# Altium schematic sheet Chip.SchDoc
size D; SheetNumber: 7; SheetTotal: 8
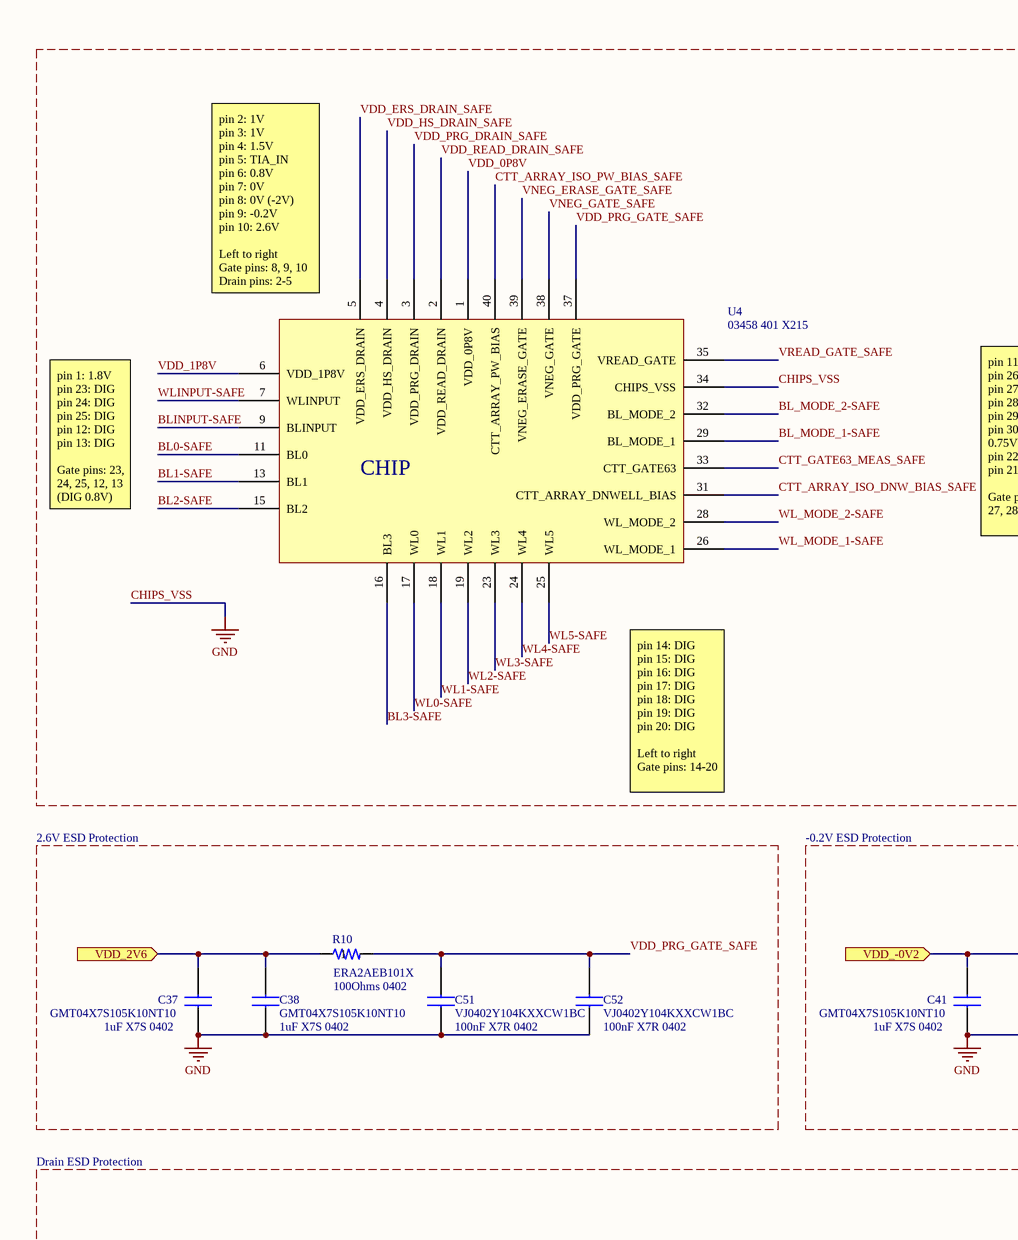
[diagram p0: Chip.SchDoc, top left]
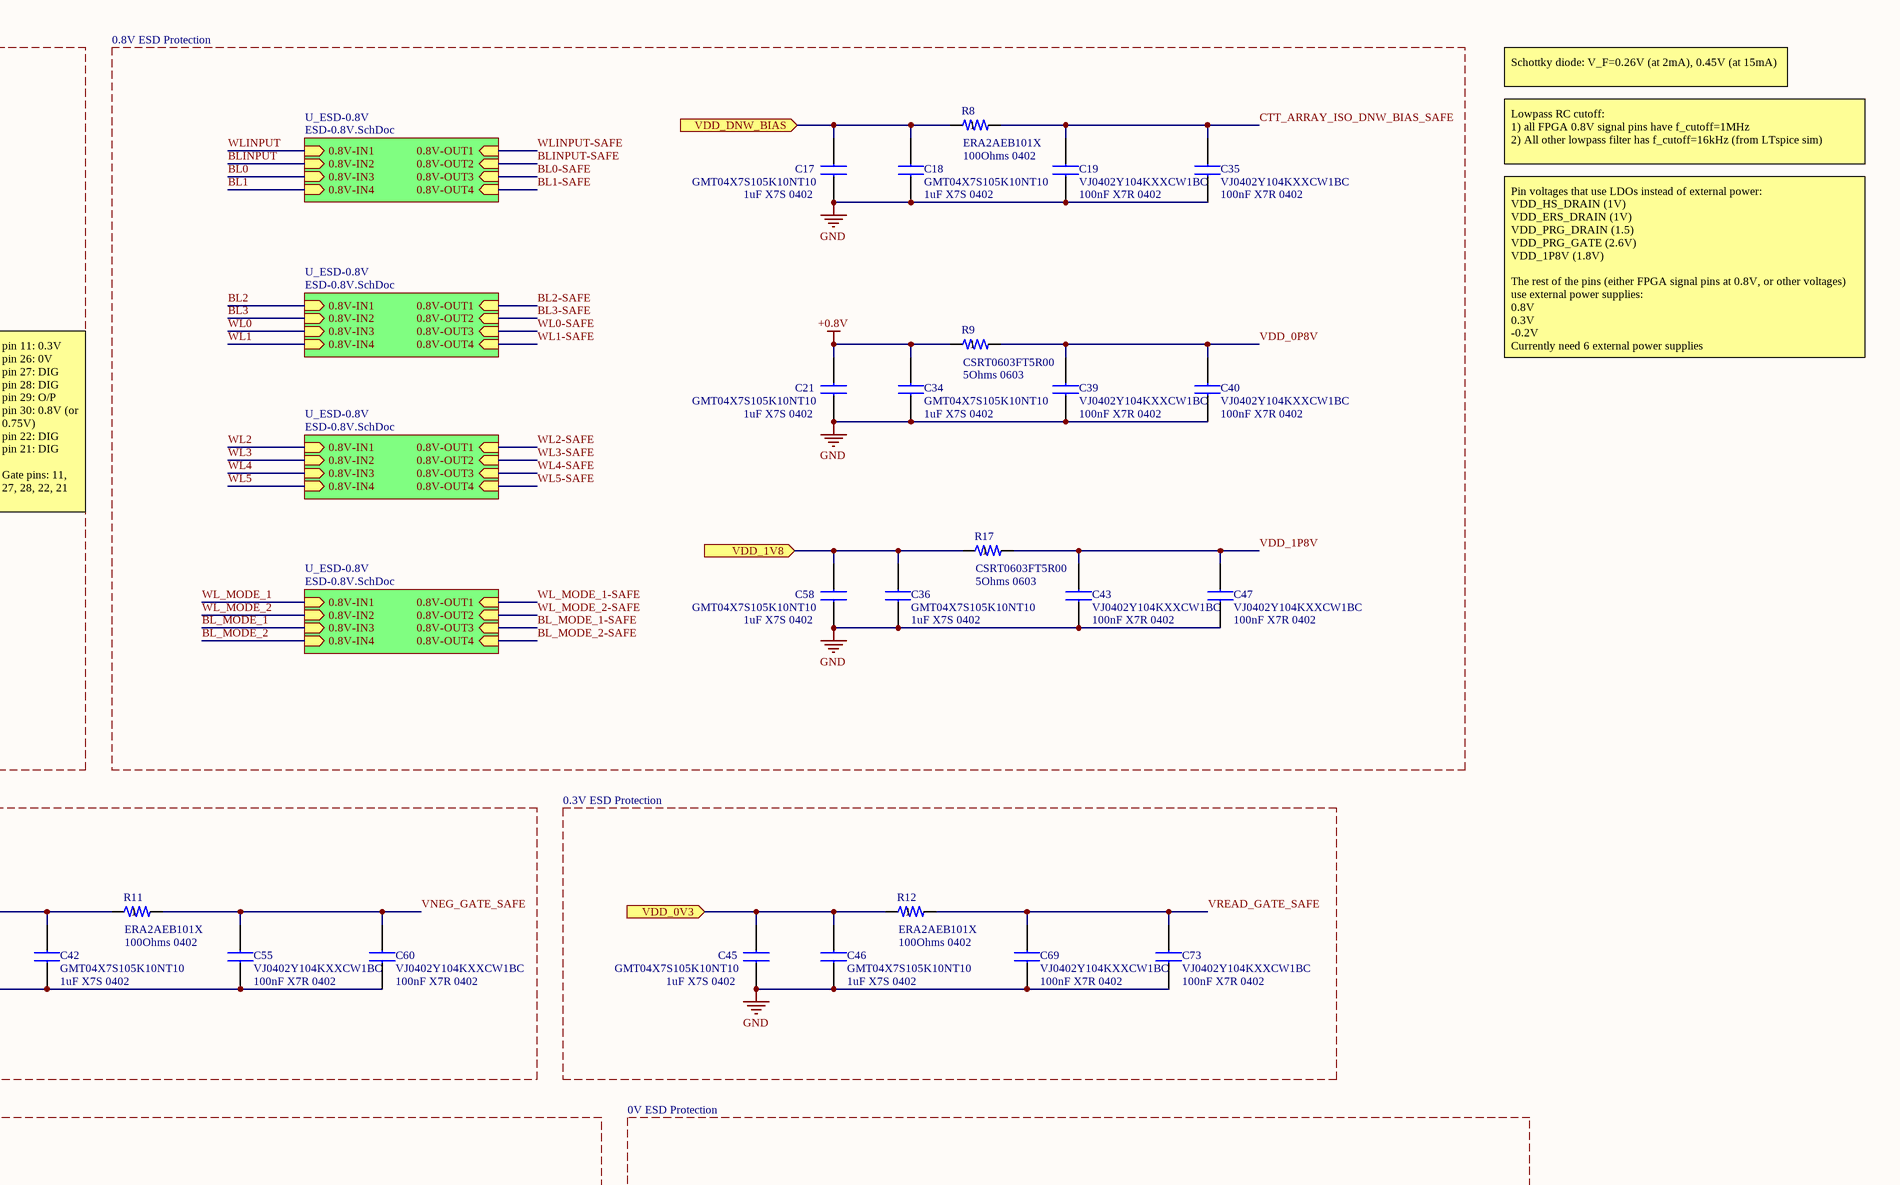
[diagram p1: Chip.SchDoc, top right]
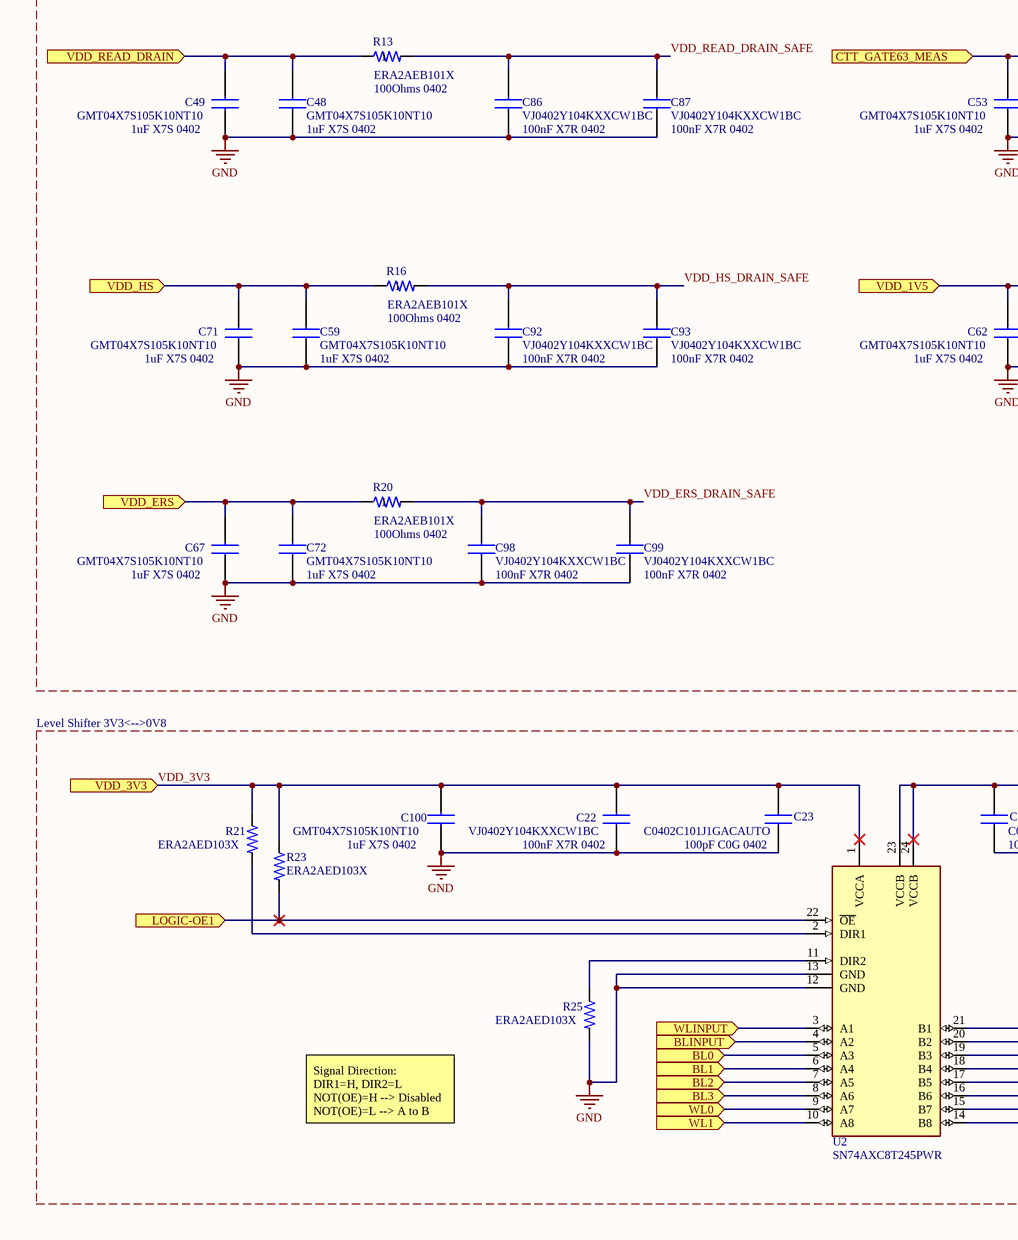
[diagram p2: Chip.SchDoc, bottom left]
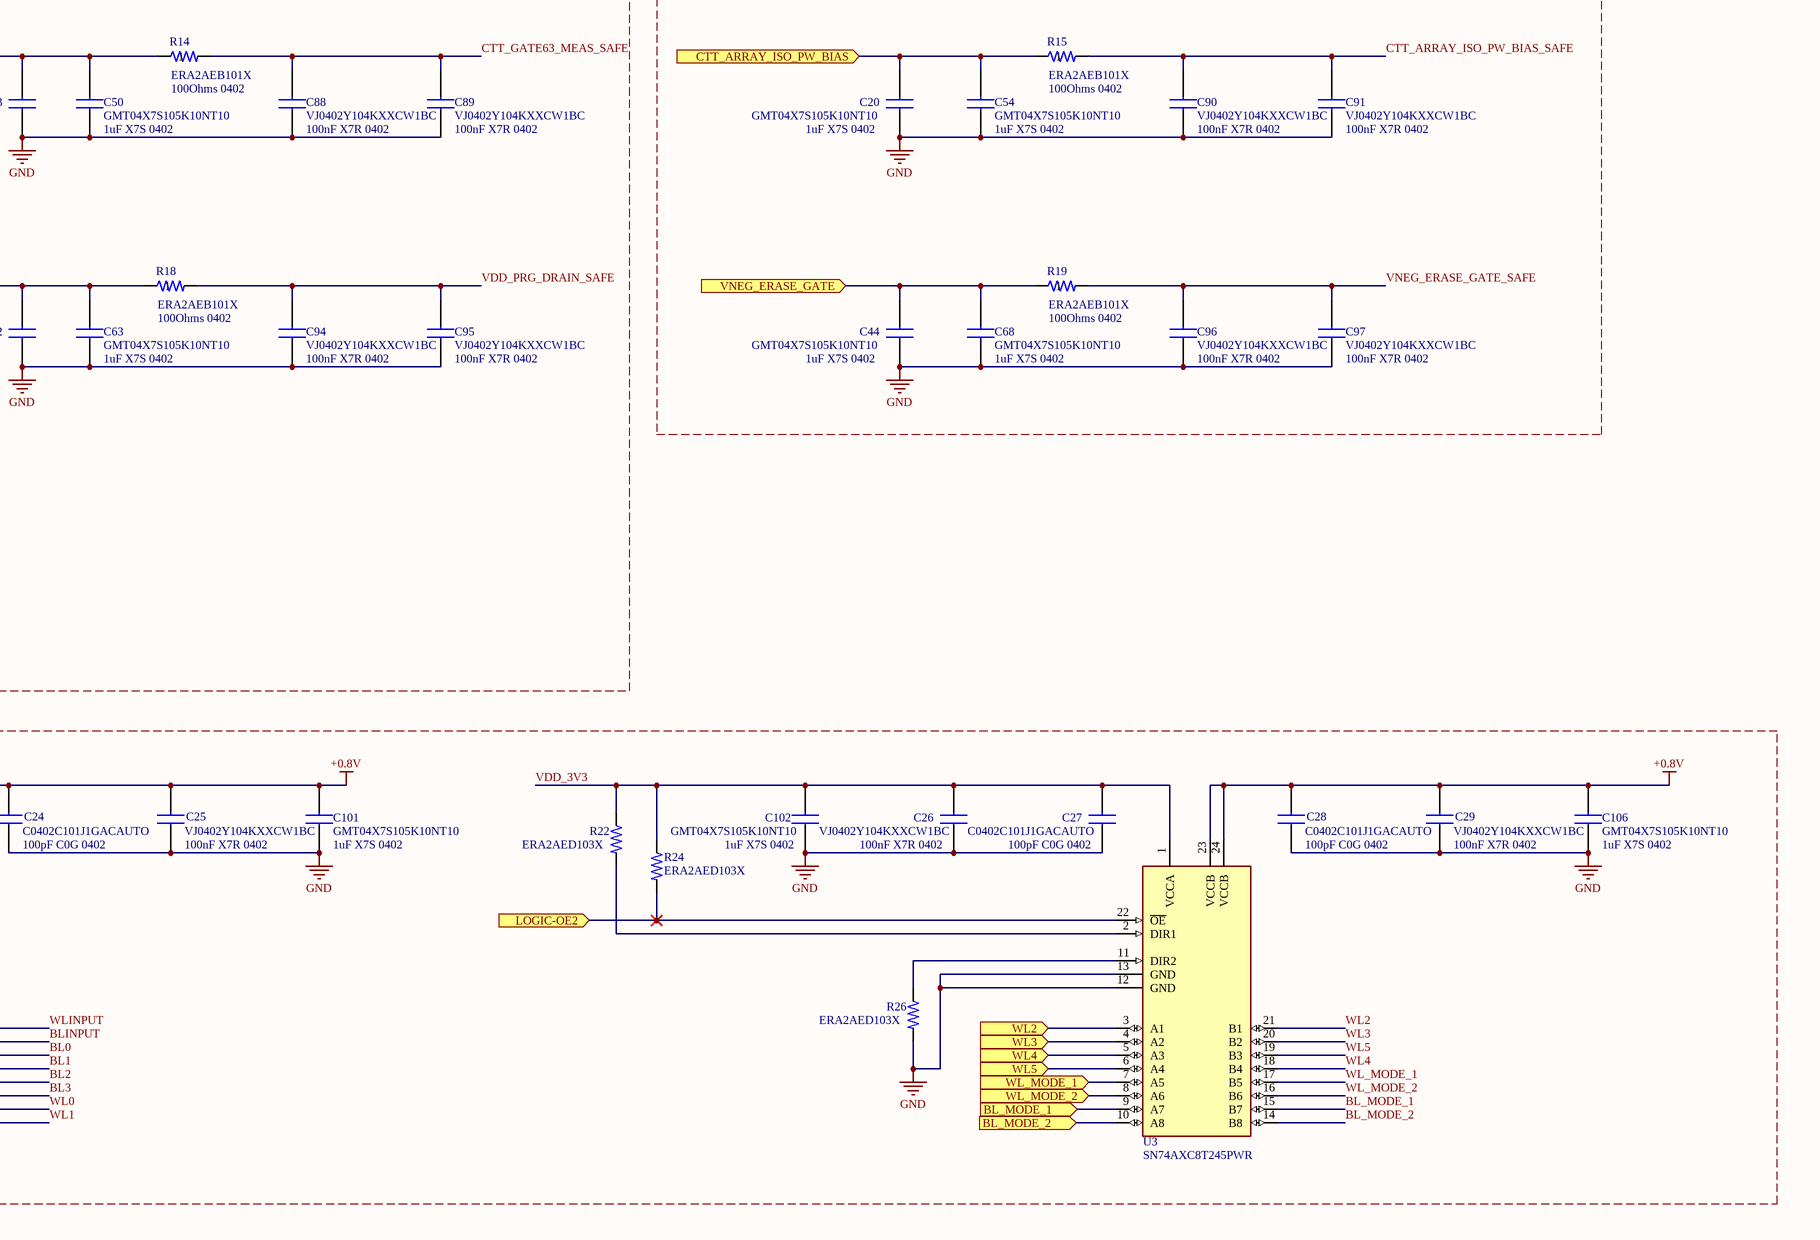
[diagram p3: Chip.SchDoc, bottom right]

## Parts
C17  GMT04X7S105K10NT10  [CAPC1005X55N]
C18  GMT04X7S105K10NT10  [CAPC1005X55N]
C19  VJ0402Y104KXXCW1BC  [CAPC1005X55N]
C20  GMT04X7S105K10NT10  [CAPC1005X55N]
C21  GMT04X7S105K10NT10  [CAPC1005X55N]
C22  VJ0402Y104KXXCW1BC  [CAPC1005X55N]
C23  C0402C101J1GACAUTO  [CAPC1005X55N]
C24  C0402C101J1GACAUTO  [CAPC1005X55N]
C25  VJ0402Y104KXXCW1BC  [CAPC1005X55N]
C26  VJ0402Y104KXXCW1BC  [CAPC1005X55N]
C27  C0402C101J1GACAUTO  [CAPC1005X55N]
C28  C0402C101J1GACAUTO  [CAPC1005X55N]
C29  VJ0402Y104KXXCW1BC  [CAPC1005X55N]
C34  GMT04X7S105K10NT10  [CAPC1005X55N]
C35  VJ0402Y104KXXCW1BC  [CAPC1005X55N]
C36  GMT04X7S105K10NT10  [CAPC1005X55N]
C37  GMT04X7S105K10NT10  [CAPC1005X55N]
C38  GMT04X7S105K10NT10  [CAPC1005X55N]
C39  VJ0402Y104KXXCW1BC  [CAPC1005X55N]
C40  VJ0402Y104KXXCW1BC  [CAPC1005X55N]
C41  GMT04X7S105K10NT10  [CAPC1005X55N]
C42  GMT04X7S105K10NT10  [CAPC1005X55N]
C43  VJ0402Y104KXXCW1BC  [CAPC1005X55N]
C44  GMT04X7S105K10NT10  [CAPC1005X55N]
C45  GMT04X7S105K10NT10  [CAPC1005X55N]
C46  GMT04X7S105K10NT10  [CAPC1005X55N]
C47  VJ0402Y104KXXCW1BC  [CAPC1005X55N]
C48  GMT04X7S105K10NT10  [CAPC1005X55N]
C49  GMT04X7S105K10NT10  [CAPC1005X55N]
C50  GMT04X7S105K10NT10  [CAPC1005X55N]
C51  VJ0402Y104KXXCW1BC  [CAPC1005X55N]
C52  VJ0402Y104KXXCW1BC  [CAPC1005X55N]
C53  GMT04X7S105K10NT10  [CAPC1005X55N]
C54  GMT04X7S105K10NT10  [CAPC1005X55N]
C55  VJ0402Y104KXXCW1BC  [CAPC1005X55N]
C58  GMT04X7S105K10NT10  [CAPC1005X55N]
C59  GMT04X7S105K10NT10  [CAPC1005X55N]
C60  VJ0402Y104KXXCW1BC  [CAPC1005X55N]
C62  GMT04X7S105K10NT10  [CAPC1005X55N]
C63  GMT04X7S105K10NT10  [CAPC1005X55N]
C67  GMT04X7S105K10NT10  [CAPC1005X55N]
C68  GMT04X7S105K10NT10  [CAPC1005X55N]
C69  VJ0402Y104KXXCW1BC  [CAPC1005X55N]
C71  GMT04X7S105K10NT10  [CAPC1005X55N]
C72  GMT04X7S105K10NT10  [CAPC1005X55N]
C73  VJ0402Y104KXXCW1BC  [CAPC1005X55N]
C86  VJ0402Y104KXXCW1BC  [CAPC1005X55N]
C87  VJ0402Y104KXXCW1BC  [CAPC1005X55N]
C88  VJ0402Y104KXXCW1BC  [CAPC1005X55N]
C89  VJ0402Y104KXXCW1BC  [CAPC1005X55N]
C90  VJ0402Y104KXXCW1BC  [CAPC1005X55N]
C91  VJ0402Y104KXXCW1BC  [CAPC1005X55N]
C92  VJ0402Y104KXXCW1BC  [CAPC1005X55N]
C93  VJ0402Y104KXXCW1BC  [CAPC1005X55N]
C94  VJ0402Y104KXXCW1BC  [CAPC1005X55N]
C95  VJ0402Y104KXXCW1BC  [CAPC1005X55N]
C96  VJ0402Y104KXXCW1BC  [CAPC1005X55N]
C97  VJ0402Y104KXXCW1BC  [CAPC1005X55N]
C98  VJ0402Y104KXXCW1BC  [CAPC1005X55N]
C99  VJ0402Y104KXXCW1BC  [CAPC1005X55N]
C100  GMT04X7S105K10NT10  [CAPC1005X55N]
C101  GMT04X7S105K10NT10  [CAPC1005X55N]
C102  GMT04X7S105K10NT10  [CAPC1005X55N]
C106  GMT04X7S105K10NT10  [CAPC1005X55N]
R8  ERA2AEB101X  [RES_ERA2AEB101X]
R9  CSRT0603FT5R00  [RES_CSRT0603_STP]
R10  ERA2AEB101X  [RES_ERA2AEB101X]
R11  ERA2AEB101X  [RES_ERA2AEB101X]
R12  ERA2AEB101X  [RES_ERA2AEB101X]
R13  ERA2AEB101X  [RES_ERA2AEB101X]
R14  ERA2AEB101X  [RES_ERA2AEB101X]
R15  ERA2AEB101X  [RES_ERA2AEB101X]
R16  ERA2AEB101X  [RES_ERA2AEB101X]
R17  CSRT0603FT5R00  [RES_CSRT0603_STP]
R18  ERA2AEB101X  [RES_ERA2AEB101X]
R19  ERA2AEB101X  [RES_ERA2AEB101X]
R20  ERA2AEB101X  [RES_ERA2AEB101X]
R21  ERA2AED103X  [RES_ERA2A_PAN]
R22  ERA2AED103X  [RES_ERA2A_PAN]
R23  ERA2AED103X  [RES_ERA2A_PAN]
R24  ERA2AED103X  [RES_ERA2A_PAN]
R25  ERA2AED103X  [RES_ERA2A_PAN]
R26  ERA2AED103X  [RES_ERA2A_PAN]
U2  SN74AXC8T245PWR  [SOP65P640X120-24N]
U3  SN74AXC8T245PWR  [SOP65P640X120-24N]
U4  03458 401 X215  [03458 401 X215]

## Sub-sheets
U_ESD-0.8V = ESD-0.8V.SchDoc: 0.8V-IN1 (in), 0.8V-IN2 (in), 0.8V-IN3 (in), 0.8V-IN4 (in), 0.8V-OUT1 (in), 0.8V-OUT2 (in), 0.8V-OUT3 (in), 0.8V-OUT4 (in)
U_ESD-0.8V = ESD-0.8V.SchDoc: 0.8V-IN1 (in), 0.8V-IN2 (in), 0.8V-IN3 (in), 0.8V-IN4 (in), 0.8V-OUT1 (in), 0.8V-OUT2 (in), 0.8V-OUT3 (in), 0.8V-OUT4 (in)
U_ESD-0.8V = ESD-0.8V.SchDoc: 0.8V-IN1 (in), 0.8V-IN2 (in), 0.8V-IN3 (in), 0.8V-IN4 (in), 0.8V-OUT1 (in), 0.8V-OUT2 (in), 0.8V-OUT3 (in), 0.8V-OUT4 (in)
U_ESD-0.8V = ESD-0.8V.SchDoc: 0.8V-IN1 (in), 0.8V-IN2 (in), 0.8V-IN3 (in), 0.8V-IN4 (in), 0.8V-OUT1 (in), 0.8V-OUT2 (in), 0.8V-OUT3 (in), 0.8V-OUT4 (in)

## Ports
BL0 (in), BL1 (in), BL2 (in), BL3 (in), BL_MODE_1 (in), BL_MODE_2 (in), BLINPUT (in), CTT_ARRAY_ISO_PW_BIAS (in), CTT_GATE63_MEAS (in), LOGIC-OE1 (in), LOGIC-OE2 (in), VDD_0V3 (in), VDD_1V5 (in), VDD_1V8 (in), VDD_2V6 (in), VDD_3V3 (in), VDD_-0V2 (in), VDD_DNW_BIAS (in), VDD_ERS (in), VDD_HS (in), VDD_READ_DRAIN (in), VNEG_ERASE_GATE (in), WL0 (in), WL1 (in), WL2 (in), WL3 (in), WL4 (in), WL5 (in), WL_MODE_1 (in), WL_MODE_2 (in), WLINPUT (in)

## Nets
+0.8V: C21.2 C24.2 C25.2 C28.2 C29.2 C34.2 C101.2 C106.2 R9.1 U2.23(VCCB) U2.24(VCCB) U3.23(VCCB) U3.24(VCCB)
CHIPS_VSS: C17.1 C18.1 C19.1 C20.1 C21.1 C22.1 C23.1 C24.1 C25.1 C26.1 C27.1 C28.1 C29.1 C34.1 C35.1 C36.1 C37.1 C38.1 C39.1 C40.1 C41.1 C42.1 C43.1 C44.1 C45.1 C46.1 C47.1 C48.1 C49.1 C50.1 C51.1 C52.1 C53.1 C54.1 C55.1 C58.1 C59.1 C60.1 C62.1 C63.1 C67.1 C68.1 C69.1 C71.1 C72.1 C73.1 C86.1 C87.1 C88.1 C89.1 C90.1 C91.1 C92.1 C93.1 C94.1 C95.1 C96.1 C97.1 C98.1 C99.1 C100.1 C101.1 C102.1 C106.1 R25.2 R26.2 U2.12(GND) U2.13(GND) U3.12(GND) U3.13(GND) U4.34(CHIPS_VSS)  [also labelled GND]
BL0: U2.5(A3) ; port BL0
BL0: U2.19(B3) ; sheet U_ESD-0.8V/0.8V-IN3  [a separate net that carries the same name]
BL0-SAFE: U4.11(BL0) ; sheet U_ESD-0.8V/0.8V-OUT3
BL1: U2.6(A4) ; port BL1
BL1: U2.18(B4) ; sheet U_ESD-0.8V/0.8V-IN4  [a separate net that carries the same name]
BL1-SAFE: U4.13(BL1) ; sheet U_ESD-0.8V/0.8V-OUT4
BL2: U2.7(A5) ; port BL2
BL2: U2.17(B5) ; sheet U_ESD-0.8V/0.8V-IN1  [a separate net that carries the same name]
BL2-SAFE: U4.15(BL2) ; sheet U_ESD-0.8V/0.8V-OUT1
BL3: U2.8(A6) ; port BL3
BL3: U2.16(B6) ; sheet U_ESD-0.8V/0.8V-IN2  [a separate net that carries the same name]
BL3-SAFE: U4.16(BL3) ; sheet U_ESD-0.8V/0.8V-OUT2
BL_MODE_1: U3.9(A7) ; port BL_MODE_1
BL_MODE_1: U3.15(B7) ; sheet U_ESD-0.8V/0.8V-IN3  [a separate net that carries the same name]
BL_MODE_1-SAFE: U4.29(BL_MODE_1) ; sheet U_ESD-0.8V/0.8V-OUT3
BL_MODE_2: U3.10(A8) ; port BL_MODE_2
BL_MODE_2: U3.14(B8) ; sheet U_ESD-0.8V/0.8V-IN4  [a separate net that carries the same name]
BL_MODE_2-SAFE: U4.32(BL_MODE_2) ; sheet U_ESD-0.8V/0.8V-OUT4
BLINPUT: U2.4(A2) ; port BLINPUT
BLINPUT: U2.20(B2) ; sheet U_ESD-0.8V/0.8V-IN2  [a separate net that carries the same name]
BLINPUT-SAFE: U4.9(BLINPUT) ; sheet U_ESD-0.8V/0.8V-OUT2
CTT_ARRAY_ISO_DNW_BIAS_SAFE: C19.2 C35.2 R8.2 U4.31(CTT_ARRAY_DNWELL_BIAS)
CTT_ARRAY_ISO_PW_BIAS: C20.2 C54.2 R15.1 ; port CTT_ARRAY_ISO_PW_BIAS
CTT_ARRAY_ISO_PW_BIAS_SAFE: C90.2 C91.2 R15.2 U4.40(CTT_ARRAY_PW_BIAS)
CTT_GATE63_MEAS: C50.2 C53.2 R14.1 ; port CTT_GATE63_MEAS
CTT_GATE63_MEAS_SAFE: C88.2 C89.2 R14.2 U4.33(CTT_GATE63)
LOGIC-OE1: R23.2 U2.22(~{OE}) ; port LOGIC-OE1
LOGIC-OE2: R24.2 U3.22(~{OE}) ; port LOGIC-OE2
VDD_0P8V: C39.2 C40.2 R9.2 U4.1(VDD_0P8V)
VDD_0V3: C45.2 C46.2 R12.1 ; port VDD_0V3
VDD_1P8V: C43.2 C47.2 R17.2 U4.6(VDD_1P8V)
VDD_1V5: C62.2 C63.2 R18.1 ; port VDD_1V5
VDD_1V8: C36.2 C58.2 R17.1 ; port VDD_1V8
VDD_2V6: C37.2 C38.2 R10.1 ; port VDD_2V6
VDD_3V3: C22.2 C23.2 C26.2 C27.2 C100.2 C102.2 R21.1 R22.1 R23.1 R24.1 U2.1(VCCA) U3.1(VCCA) ; port VDD_3V3
VDD_-0V2: C41.2 C42.2 R11.1 ; port VDD_-0V2
VDD_DNW_BIAS: C17.2 C18.2 R8.1 ; port VDD_DNW_BIAS
VDD_ERS: C67.2 C72.2 R20.1 ; port VDD_ERS
VDD_ERS_DRAIN_SAFE: C98.2 C99.2 R20.2 U4.5(VDD_ERS_DRAIN)
VDD_HS: C59.2 C71.2 R16.1 ; port VDD_HS
VDD_HS_DRAIN_SAFE: C92.2 C93.2 R16.2 U4.4(VDD_HS_DRAIN)
VDD_PRG_DRAIN_SAFE: C94.2 C95.2 R18.2 U4.3(VDD_PRG_DRAIN)
VDD_PRG_GATE_SAFE: C51.2 C52.2 R10.2 U4.37(VDD_PRG_GATE)
VDD_READ_DRAIN: C48.2 C49.2 R13.1 ; port VDD_READ_DRAIN
VDD_READ_DRAIN_SAFE: C86.2 C87.2 R13.2 U4.2(VDD_READ_DRAIN)
VNEG_ERASE_GATE: C44.2 C68.2 R19.1 ; port VNEG_ERASE_GATE
VNEG_ERASE_GATE_SAFE: C96.2 C97.2 R19.2 U4.39(VNEG_ERASE_GATE)
VNEG_GATE_SAFE: C55.2 C60.2 R11.2 U4.38(VNEG_GATE)
VREAD_GATE_SAFE: C69.2 C73.2 R12.2 U4.35(VREAD_GATE)
WL0: U2.9(A7) ; port WL0
WL0: U2.15(B7) ; sheet U_ESD-0.8V/0.8V-IN3  [a separate net that carries the same name]
WL0-SAFE: U4.17(WL0) ; sheet U_ESD-0.8V/0.8V-OUT3
WL1: U2.10(A8) ; port WL1
WL1: U2.14(B8) ; sheet U_ESD-0.8V/0.8V-IN4  [a separate net that carries the same name]
WL1-SAFE: U4.18(WL1) ; sheet U_ESD-0.8V/0.8V-OUT4
WL2: U3.3(A1) ; port WL2
WL2: U3.21(B1) ; sheet U_ESD-0.8V/0.8V-IN1  [a separate net that carries the same name]
WL2-SAFE: U4.19(WL2) ; sheet U_ESD-0.8V/0.8V-OUT1
WL3: U3.4(A2) ; port WL3
WL3: U3.20(B2) ; sheet U_ESD-0.8V/0.8V-IN2  [a separate net that carries the same name]
WL3-SAFE: U4.23(WL3) ; sheet U_ESD-0.8V/0.8V-OUT2
WL4: U3.5(A3) ; port WL4
WL4: U3.18(B4) ; sheet U_ESD-0.8V/0.8V-IN3  [a separate net that carries the same name]
WL4-SAFE: U4.24(WL4) ; sheet U_ESD-0.8V/0.8V-OUT3
WL5: U3.6(A4) ; port WL5
WL5: U3.19(B3) ; sheet U_ESD-0.8V/0.8V-IN4  [a separate net that carries the same name]
WL5-SAFE: U4.25(WL5) ; sheet U_ESD-0.8V/0.8V-OUT4
WL_MODE_1: U3.7(A5) ; port WL_MODE_1
WL_MODE_1: U3.17(B5) ; sheet U_ESD-0.8V/0.8V-IN1  [a separate net that carries the same name]
WL_MODE_1-SAFE: U4.26(WL_MODE_1) ; sheet U_ESD-0.8V/0.8V-OUT1
WL_MODE_2: U3.8(A6) ; port WL_MODE_2
WL_MODE_2: U3.16(B6) ; sheet U_ESD-0.8V/0.8V-IN2  [a separate net that carries the same name]
WL_MODE_2-SAFE: U4.28(WL_MODE_2) ; sheet U_ESD-0.8V/0.8V-OUT2
WLINPUT: U2.3(A1) ; port WLINPUT
WLINPUT: U2.21(B1) ; sheet U_ESD-0.8V/0.8V-IN1  [a separate net that carries the same name]
WLINPUT-SAFE: U4.7(WLINPUT) ; sheet U_ESD-0.8V/0.8V-OUT1
NetR21_2: R21.2 U2.2(DIR1)
NetR22_2: R22.2 U3.2(DIR1)
NetR25_1: R25.1 U2.11(DIR2)
NetR26_1: R26.1 U3.11(DIR2)

## Notes on the sheet
- 0.8V ESD Protection
- Schottky diode: V_F=0.26V (at 2mA), 0.45V (at 15mA)
- 100Ohms 0402
- Lowpass RC cutoff:
  1) all FPGA 0.8V signal pins have f_cutoff=1MHz
  2) All other lowpass filter has f_cutoff=16kHz (from LTspice sim)
- (near C17) 1uF X7S 0402
- (near C18) 1uF X7S 0402
- (near C19) 100nF X7R 0402
- (near C35) 100nF X7R 0402
- (near U4) pin 2: 1V
  pin 3: 1V
  pin 4: 1.5V
  pin 5: TIA_IN
  pin 6: 0.8V
  pin 7: 0V
  pin 8: 0V (-2V)
  pin 9: -0.2V
  pin 10: 2.6V
  Left to right
  Gate pins: 8, 9, 10
  Drain pins: 2-5
- Pin voltages that use LDOs instead of external power:
  VDD_HS_DRAIN (1V)
  VDD_ERS_DRAIN (1V)
  VDD_PRG_DRAIN (1.5)
  VDD_PRG_GATE (2.6V)
  VDD_1P8V (1.8V)
  The rest of the pins (either FPGA signal pins at 0.8V, or other voltages) use external power supplies:
  0.8V
  0.3V
  -0.2V
  Currently need 6 external power supplies
- (near C21) 1uF X7S 0402
- (near C34) 1uF X7S 0402
- (near R9) 5Ohms 0603
- (near C39) 100nF X7R 0402
- (near C40) 100nF X7R 0402
- pin 1: 1.8V
  pin 23: DIG
  pin 24: DIG
  pin 25: DIG
  pin 12: DIG
  pin 13: DIG
  Gate pins: 23, 24, 25, 12, 13 (DIG 0.8V)
- pin 11: 0.3V
  pin 26: 0V
  pin 27: DIG
  pin 28: DIG
  pin 29: O/P
  pin 30: 0.8V (or 0.75V)
  pin 22: DIG
  pin 21: DIG
  Gate pins: 11, 27, 28, 22, 21
- (near C58) 1uF X7S 0402
- (near C36) 1uF X7S 0402
- (near R17) 5Ohms 0603
- (near C43) 100nF X7R 0402
- (near C47) 100nF X7R 0402
- pin 14: DIG
  pin 15: DIG
  pin 16: DIG
  pin 17: DIG
  pin 18: DIG
  pin 19: DIG
  pin 20: DIG
  Left to right
  Gate pins: 14-20
- 2.6V ESD Protection
- -0.2V ESD Protection
- 0.3V ESD Protection
- (near R11) 100Ohms 0402
- (near R12) 100Ohms 0402
- (near C37) 1uF X7S 0402
- (near C38) 1uF X7S 0402
- (near C51) 100nF X7R 0402
- (near C52) 100nF X7R 0402
- (near C41) 1uF X7S 0402
- (near C42) 1uF X7S 0402
- (near C55) 100nF X7R 0402
- (near C60) 100nF X7R 0402
- (near C45) 1uF X7S 0402
- (near C46) 1uF X7S 0402
- (near C69) 100nF X7R 0402
- (near C73) 100nF X7R 0402
- Drain ESD Protection
- 0V ESD Protection
- (near R13) 100Ohms 0402
- (near R14) 100Ohms 0402
- (near R15) 100Ohms 0402
- (near C49) 1uF X7S 0402
- (near C48) 1uF X7S 0402
- (near C86) 100nF X7R 0402
- (near C87) 100nF X7R 0402
- (near C53) 1uF X7S 0402
- (near C50) 1uF X7S 0402
- (near C88) 100nF X7R 0402
- (near C89) 100nF X7R 0402
- (near C20) 1uF X7S 0402
- (near C54) 1uF X7S 0402
- (near C90) 100nF X7R 0402
- (near C91) 100nF X7R 0402
- (near R16) 100Ohms 0402
- (near R18) 100Ohms 0402
- (near R19) 100Ohms 0402
- (near C71) 1uF X7S 0402
- (near C59) 1uF X7S 0402
- (near C92) 100nF X7R 0402
- (near C93) 100nF X7R 0402
- (near C62) 1uF X7S 0402
- (near C63) 1uF X7S 0402
- (near C94) 100nF X7R 0402
- (near C95) 100nF X7R 0402
- (near C44) 1uF X7S 0402
- (near C68) 1uF X7S 0402
- (near C96) 100nF X7R 0402
- (near C97) 100nF X7R 0402
- (near C67) 1uF X7S 0402
- (near C72) 1uF X7S 0402
- (near C98) 100nF X7R 0402
- (near C99) 100nF X7R 0402
- Level Shifter 3V3<-->0V8
- (near C100) 1uF X7S 0402
- (near C22) 100nF X7R 0402
- (near C23) 100pF C0G 0402
- (near C24) 100pF C0G 0402
- (near C25) 100nF X7R 0402
- (near C101) 1uF X7S 0402
- (near C102) 1uF X7S 0402
- (near C26) 100nF X7R 0402
- (near C27) 100pF C0G 0402
- (near C28) 100pF C0G 0402
- (near C29) 100nF X7R 0402
- (near C106) 1uF X7S 0402
- Signal Direction:
  DIR1=H, DIR2=L
  NOT(OE)=H --> Disabled
  NOT(OE)=L --> A to B
- (in symbol 03458 401 X215) CHIP

## Library data of the parts
C17 C18 C20 C21 C34 C36-C38 C41 C42 C44-C46 C48-C50 C53 C54 C58 C59 C62 C63 C67 C68 C71 C72 C100-C102 C106 = GMT04X7S105K10NT10: 1 µF ±10% 10V Ceramic Capacitor X7S 0402 (1005 Metric); MF: Vishay Vitramon; MP: VJ0402Y104KXXCW1BC; SnapEDA_Link: https://www.snapeda.com/parts/VJ0402Y104KXXCW1BC/Vishay/view-part/?ref=snap; Package: 0402-2 VISHAY; Value: *; Check_prices: https://www.snapeda.com/parts/VJ0402Y104KXXCW1BC/Vishay/view-part/?ref=eda
C19 C22 C25 C26 C29 C35 C39 C40 C43 C47 C51 C52 C55 C60 C69 C73 C86-C99 = VJ0402Y104KXXCW1BC: 0.1 ÂµF Â±10% 25V Ceramic Capacitor X7R 0402 (1005 Metric); MF: Vishay Vitramon; SnapEDA_Link: https://www.snapeda.com/parts/VJ0402Y104KXXCW1BC/Vishay/view-part/?ref=snap; Package: 0402-2 VISHAY; Value: *; MP: VJ0402Y104KXXCW1BC; Check_prices: https://www.snapeda.com/parts/VJ0402Y104KXXCW1BC/Vishay/view-part/?ref=eda
C23 C24 C27 C28 = C0402C101J1GACAUTO: 100 pF ±5% 100V Ceramic Capacitor C0G, NP0 0402 (1005 Metric); MF: {'manufacturer': u'KEMET'}; Package: None; Price: None; Value: *; MP: C0402C101J1GACAUTO; Availability: Unavailable
R8 R10-R16 R18-R20 = ERA2AEB101X: 100 Ohms ±0.1% 0.063W, 1/16W Chip Resistor 0402 (1005 Metric) Automotive AEC-Q200 Thin Film; Availability: Unavailable; Package: None; MP: ERA2AEB101X; Value: *; Price: None
R9 R17 = CSRT0603FT5R00: 5 Ohms ±1% 0.4W Chip Resistor 0603 (1608 Metric) Automotive AEC-Q200, Current Sense Thin Film; Manufacturer_Name: Stackpole International; Type: Chip Resistor - Surface Mount; Copyright: Copyright (C) 2025 Ultra Librarian. All rights reserved.; Manufacturer_Part_Number: CSRT0603FT5R00
R21-R26 = ERA2AED103X: 10 kOhms ±0.5% 0.063W, 1/16W Chip Resistor 0402 (1005 Metric) Automotive AEC-Q200 Thin Film; MF: Yageo; MP: RC0402FR-070RL; SnapEDA_Link: https://www.snapeda.com/parts/RC0402FR-070RL/Yageo/view-part/?ref=snap; Package: 0402 Yageo; Value: *; Check_prices: https://www.snapeda.com/parts/RC0402FR-070RL/Yageo/view-part/?ref=eda; ComponentLink1Description: Digikey link; ComponentLink1URL: https://www.digikey.com/en/products/detail/panasonic-industry/ERA-2AED103X/1706126
U2 U3 = SN74AXC8T245PWR: 8-bit dual-supply bus transceiver; MF: Texas Instruments; SnapEDA_Link: https://www.snapeda.com/parts/SN74AXC8T245PWR/Texas+Instruments/view-part/?ref=snap; Package: TSSOP-24 Texas Instruments; Value: *; MP: SN74AXC8T245PWR; Check_prices: https://www.snapeda.com/parts/SN74AXC8T245PWR/Texas+Instruments/view-part/?ref=eda; ComponentLink1Description: Digikey link; ComponentLink1URL: SN74AXC8T245PWR
U4 = 03458 401 X215: 40 Input/Output (I/O) and 1.02 Millimeter (mm) Pitch / Lead Chip Carrier (LCC) Socket with Castellations (live-bug load)